# Altium project PiggySat-board.PrjPcb
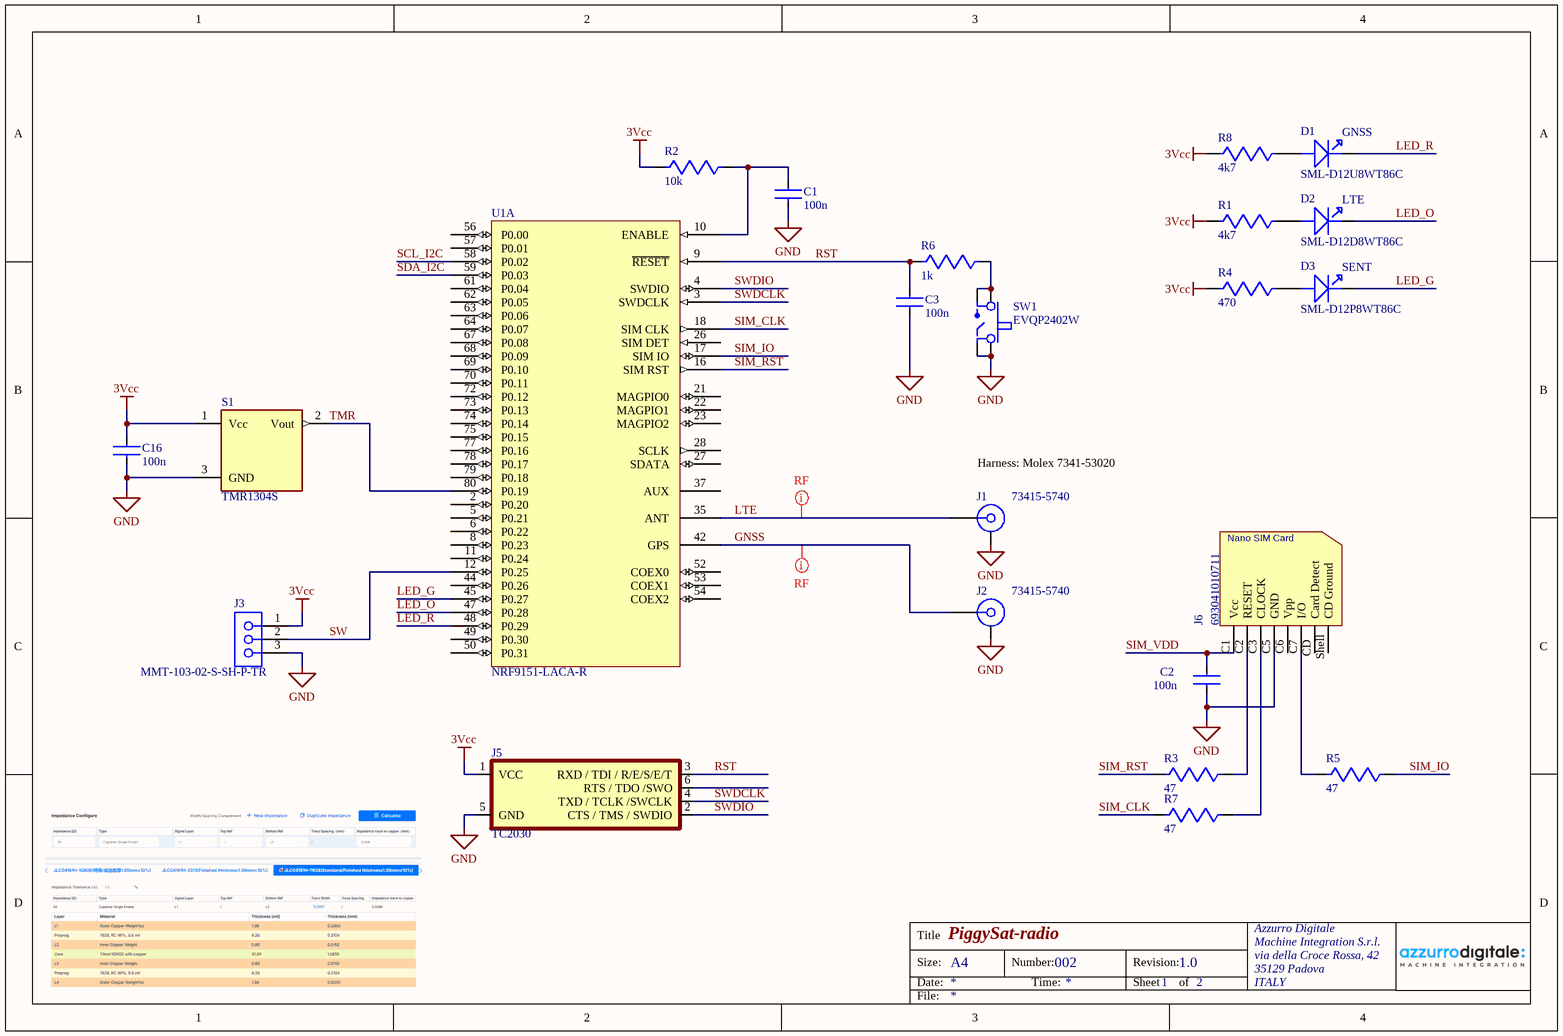
[diagram p0: PiggySat-radio.SchDoc]
2 sheets, 45 parts. Net scope: global (net labels, ports and power ports of the same name join across sheets).
Board file: PiggySat-board.PcbDoc
Sheets:
  PiggySat-radio.SchDoc
  PiggySat-power.SchDoc

## Sheet PiggySat-radio.SchDoc: PiggySat-radio
size A4; DocumentNumber: 002; Revision: 1.0; SheetNumber: 1; SheetTotal: 2

### Parts
C1  100n  [CAPC1608X06L]
C2  100n  [CAPC1608X06L]
C3  100n  [CAPC1608X06L]
C16  100n  [CAPC1608X06L]
D1  SML-D12U8WT86C  [SML-D12]
D2  SML-D12D8WT86C  [SML-D12]
D3  SML-D12P8WT86C  [SML-D12]
J1  73415-5740  [MOLEX_734155740]
J2  73415-5740  [MOLEX_734155740]
J3  MMT-103-02-S-SH-P-TR  [MMT-103-01-SM-SH-TR]
J5  TC2030  [TC2030-IDC]  (no BOM)
J6  693041010711  [693041010711]
R1  4k7  [RESC1005X04L]
R2  10k  [RESC1005X04L]
R3  47  [RESC1005X04L]
R4  470  [RESC1005X04L]
R5  47  [RESC1005X04L]
R6  1k  [RESC1005X04L]
R7  47  [RESC1005X04L]
R8  4k7  [RESC1005X04L]
S1  TMR1304S  [SOT-23-3]
SW1  EVQP2402W  [EVQP2402W]
U1  NRF9151-LACA-R  [FP-nRF9151-LACA-R_MFG]  (part A of 2)

### Nets
3Vcc: C16.1 J3.1 J5.1(VCC) R1.1 R2.1 R4.1 R8.1 S1.1(Vcc)
GND: C1.2 C2.1 C3.1 C16.2 J1.2 J2.2 J3.3 J5.5(GND) J6.C5(GND) S1.3(GND) SW1.1 SW1.3
GNSS: J2.1 U1.42(GPS)
LED_G: D3.2 U1.45(P0.27)
LED_O: D2.2 U1.47(P0.28)
LED_R: D1.2 U1.48(P0.29)
LTE: J1.1 U1.35(ANT)
RST: C3.2 J5.3(RXD_/_TDI_/_R/E/S/E/T) R6.2 U1.9(~{RESET})
SCL_I2C: U1.58(P0.02)
SDA_I2C: U1.59(P0.03)
SIM_CLK: R7.1 U1.18(SIM_CLK)
SIM_IO: R5.2 U1.17(SIM_IO)
SIM_RST: R3.1 U1.16(SIM_RST)
SIM_VDD: C2.2 J6.C1(Vcc)
SW: J3.2 U1.12(P0.25)
SWDCLK: J5.4(TXD_/_TCLK_/SWCLK) U1.3(SWDCLK)
SWDIO: J5.2(CTS_/_TMS_/_SWDIO) U1.4(SWDIO)
TMR: S1.2(Vout) U1.80(P0.19)
NetC1_1: C1.1 R2.2 U1.10(ENABLE)
NetD1_1: D1.1 R8.2
NetD2_1: D2.1 R1.2
NetD3_1: D3.1 R4.2
NetJ6_C2: J6.C2(RESET) R3.2
NetJ6_C3: J6.C3(CLOCK) R7.2
NetJ6_C7: J6.C7(I/O) R5.1
NetR6_1: R6.1 SW1.2 SW1.4

Not connected (* = marked no-connect by the designer): J5 6(RTS_/_TDO_/SWO); J6 C6(Vpp) CD(Card_Detect) Shell(CD_Ground); U1 2(P0.20) 5(P0.21) 6(P0.22) 8(P0.23) 11(P0.24) 21(MAGPIO0) 22(MAGPIO1) 23(MAGPIO2) 26(SIM_DET) 27(SDATA) 28(SCLK) 37(AUX) 44(P0.26) 49(P0.30) 50(P0.31) 52(COEX0) 53(COEX1) 54(COEX2) 56(P0.00) 57(P0.01) 61(P0.04) 62(P0.05) 63(P0.06) 64(P0.07) 67(P0.08) 68(P0.09) 69(P0.10) 70(P0.11) 72(P0.12) 73(P0.13) 74(P0.14) 75(P0.15) 77(P0.16) 78(P0.17) 79(P0.18)

### Layout directives
net class RF: GNSS, LTE

### Notes on the sheet
- (near D1) GNSS
- (near D2) LTE
- (near D3) SENT
- (near J1) Harness: Molex 7341-53020
- Title
- Size:
- Date:
- A4
- Number:
- Time:
- Revision:
- Sheet
- of
- Azzurro Digitale
- Machine Integration S.r.l.
- via della Croce Rossa, 42
- 35129 Padova
- ITALY
- File:
- (in symbol CMP-03913-167535528-1) Nano SIM Card

### Library data of the parts
C1-C3 C16 = CMP-001-00001-3: Cap 16V 100n X7R 0603 10%; Component Class: Capacitors
D1 = CMP-007-000019-1: LED, 0603, Red, SMD, 0,8mm x 1,6mm, 20 mA, 2.2 V, 620 nm; Cod. Alt.: (); Comment1: LED0805; Cod. Mag.: LV-SMD-0805; Design Item ID: SML-D12U8WT86C; Montaggio: (); Cod. Fornitore: (); Prezzo: (); Source: Altium_Library.SchLib; Fornitore: ()
D2 = CMP-007-000019-1: LED, 0603, Orange, SMD, 0,8mm x 1,6mm, 20 mA, 2.2 V, 620 nm; Cod. Alt.: (); Comment1: LED0805; Cod. Mag.: LV-SMD-0805; Design Item ID: SML-D12D8WT86C; Montaggio: (); Cod. Fornitore: (); Prezzo: (); Source: Altium_Library.SchLib; Fornitore: ()
D3 = CMP-007-000018-1: LED, 0603, Green, SMD, 0,8mm x 1,6mm, 20 mA, 2.2 V, 560 nm; Cod. Fornitore: (); Comment1: LED0805; Cod. Mag.: LV-SMD-0805; Fornitore: (); Montaggio: (); Design Item ID: SML-D12P8WT86C; Prezzo: (); Source: Altium_Library.SchLib; Cod. Alt.: ()
J1 J2 = 73415-5740: SMP PLUG, PCB EDGE MNT, SMOOTH B; Manufacturer: MOLEX; System: Connector; ComponentLink5Description: Webshop / RFQ; ComponentLink5URL: http://www.rosenberger.com/en/contact/sales/; ComponentLink3URL: http://rosenberger.de/ok/images/documents/db/32K145-400L5.pdf; ComponentLink2URL: http://rosenberger.de/ok/images/documents/db/32K145-400L5.pdf; ComponentLink4Description: Series Overview / Design Note; ComponentLink1Description: Manufacturer URL; ComponentLink2Description: Datasheet; ComponentLink3Description: Package Specification; ComponentLink1URL: http://www.rosenberger.de; ComponentLink4URL: http://rosenberger.de/ok/images/documents/spez/32.pdf; Mounting Technology: Surface Mount
J3 = MMT-103-01-SM-SH-TR: MMT Series 2.00 mm Horizontal Surface Mount Terminal Strip; System: Connector
J5 = CMP-002-000000-4: Serial cable 6-pin “Legged” Tag-Connector.
J6 = CMP-03913-167535528-1: WR-CRD SIM Card Connectors /
R1 R8 = CMP-009-00001-2: Res 4.7k 0402
R2 = CMP-009-00001-2: Res 10k 0402
R3 R5 R7 = CMP-009-00001-2: Res 47 0402
R4 = CMP-009-00001-2: Res 470 0402
R6 = CMP-009-00001-2: Res 1k 0402
S1 = CMP-00000-2: TMR130x is an omnipolar magnetic switch integrated the tunnel magnetoresistance (TMR) magnetic sensor and CMOS circuitry
SW1 = CMP-017-000001-1: Light Touch Switches/EVQP2/P9/3P2; Design Item ID: EVQP2402W; Source: Altium_Library.SchLib
U1 = CMP-00045-6: Lower Power SIP for cellular IoT and DECT NR+, Compatible with nRF Cloud Services; Number of ADC Channels: 8; Interface: 2-Wire, I2C, I2S, SPI, UART, USB; Max Supply Voltage: 5.5V; Number of GPIO: 32; Data Rate: 3.4Mbps; Bandwidth: 1.5GHz; Min Supply Voltage: 1.7V; Clock Frequency: 2.2GHz; Min Operating Temperature: -40°C; Height: 1.3mm; Max Operating Temperature: 85°C; RoHS: Compliant; Ambient Temperature Range High: 85°C

## Sheet PiggySat-power.SchDoc: PiggySat-power
size A4; DocumentNumber: 003; Revision: 1.0; SheetNumber: 2; SheetTotal: 2
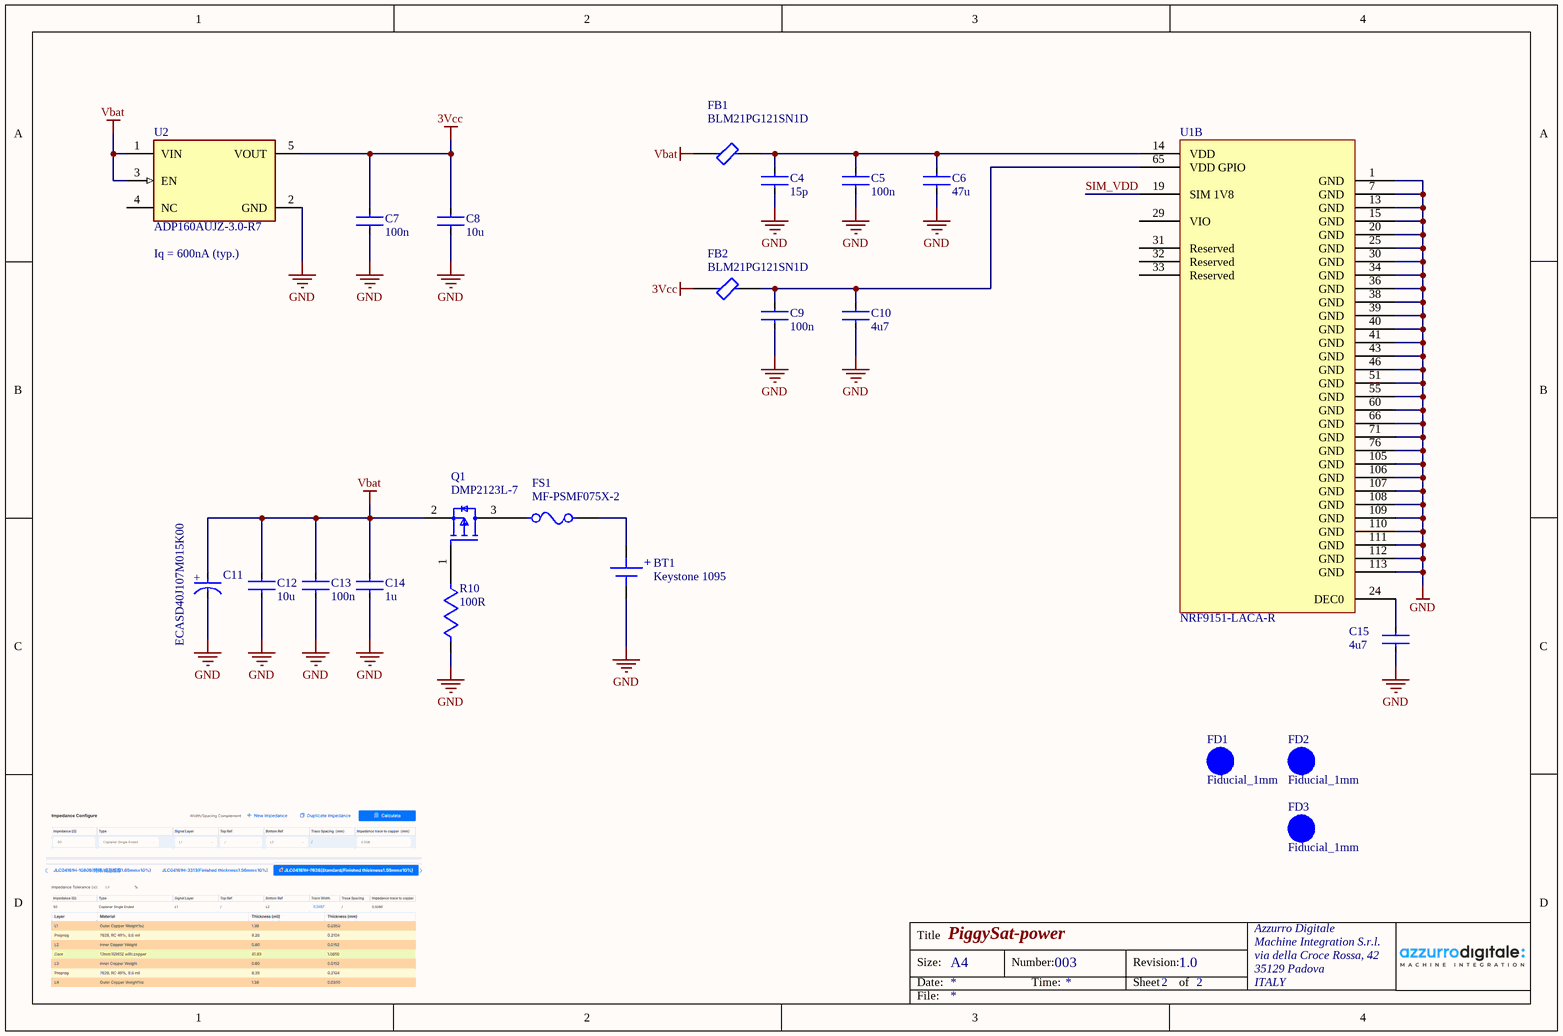
[diagram p1: PiggySat-power.SchDoc]

### Parts
BT1  Keystone 1095  [KEYSTONE 1095]
C4  15p  [CAPC1608X06L]
C5  100n  [CAPC1608X06L]
C6  47u  [CAPC2012X11L]
C7  100n  [CAPC1608X06L]
C8  10u  [CAPC1608X06L]
C9  100n  [CAPC1608X06L]
C10  4u7  [CAPC1608X06L]
C11  ECASD40J107M015K00  [FP-ECAS-D4-MFG]
C12  10u  [CAPC1608X06L]
C13  100n  [CAPC1608X06L]
C14  1u  [CAPC1608X06L]
C15  4u7  [CAPC1608X06L]
FB1  BLM21PG121SN1D  [FP-BLM21-0_2-t0_85-e0_5-d-IPC_C]
FB2  BLM21PG121SN1D  [FP-BLM21-0_2-t0_85-e0_5-d-IPC_C]
FD1  Fiducial_1mm  [Fiducial_1mm-Footprint-1]  (no BOM)
FD2  Fiducial_1mm  [Fiducial_1mm-Footprint-1]  (no BOM)
FD3  Fiducial_1mm  [Fiducial_1mm-Footprint-1]  (no BOM)
FS1  MF-PSMF075X-2  [FP-MF-PSMF-MFG]
Q1  DMP2123L-7  [FP-SOT23-MFG]
R10  100R  [RESC1005X04L]
U1  NRF9151-LACA-R  [FP-nRF9151-LACA-R_MFG]  (part B of 2)
U2  ADP160AUJZ-3.0-R7  [FP-UJ-5-IPC_A]

### Nets
3Vcc: C7.2 C8.2 FB2.2 U2.5(VOUT)
GND: BT1.N C4.1 C5.1 C6.1 C7.1 C8.1 C9.1 C10.1 C11.1(C) C12.1 C13.1 C14.1 C15.1 R10.2 U1.1(GND) U1.7(GND) U1.13(GND) U1.15(GND) U1.20(GND) U1.25(GND) U1.30(GND) U1.34(GND) U1.36(GND) U1.38(GND) U1.39(GND) U1.40(GND) U1.41(GND) U1.43(GND) U1.46(GND) U1.51(GND) U1.55(GND) U1.60(GND) U1.66(GND) U1.71(GND) U1.76(GND) U1.105(GND) U1.106(GND) U1.107(GND) U1.108(GND) U1.109(GND) U1.110(GND) U1.111(GND) U1.112(GND) U1.113(GND) U2.2(GND)
Vbat: C11.2(A) C12.2 C13.2 C14.2 FB1.2 Q1.2(S) U2.1(VIN) U2.3(EN)
SIM_VDD: U1.19(SIM_1V8)
NetBT1_P: BT1.P FS1.2
NetC4_2: C4.2 C5.2 C6.2 FB1.1 U1.14(VDD)
NetC9_2: C9.2 C10.2 FB2.1 U1.65(VDD_GPIO)
NetC15_2: C15.2 U1.24(DEC0)
NetFS1_1: FS1.1 Q1.3(D)
NetQ1_1: Q1.1(G) R10.1

Not connected (* = marked no-connect by the designer): U1 29(VIO) 31(Reserved) 32(Reserved) 33(Reserved); U2 4(NC)

### Notes on the sheet
- (near U2) Iq = 600nA (typ.)
- Title
- Size:
- Date:
- A4
- Number:
- Time:
- Revision:
- Sheet
- of
- Azzurro Digitale
- Machine Integration S.r.l.
- via della Croce Rossa, 42
- 35129 Padova
- ITALY
- File:
- (in symbol CMP-06031-000020-2) +
- (in symbol Keystone 1095) +

### Library data of the parts
BT1 = Keystone 1095: THM Holder for 18350 Battery P/N 1095
C4 = CMP-001-00001-3: Cap 16V 15p X7R 0603 10%; Component Class: Capacitors
C5 C7 C9 C13 = CMP-001-00001-3: Cap 16V 100n X7R 0603 10%; Component Class: Capacitors
C6 = CMP-001-00002-1: Cap 16V 47u X7R 0603 10%
C8 C12 = CMP-001-00001-3: Cap 16V 10u X7R 0603 10%; Component Class: Capacitors
C10 C15 = CMP-001-00001-3: Cap 16V 4.7u X7R 0603 10%; Component Class: Capacitors
C11 = CMP-06031-000020-2: Polymer Aluminum Electrolytic Capacitor 2917 100uF±20% 6.3V 15mΩ; Resistance: 0.015R; Polarity: Polar; Tolerance: 20%; Ripple Current: 2A; Life (Hours): 1000Hour; ESR (Equivalent Series Resistance): 15mR; Capacitance: 100uF; Depth: 4.3mm; Package Quantity: 1; Max Operating Temperature: 105°C; Voltage Rating: 6.3V; Termination: SMD/SMT; Radiation Hardening: No; Mount: Surface Mount; Construction: Flat; Case/Package: 2917; Case Code (Imperial): 2917; Height - Seated (Max): 0.075inch; Length: 7.3mm; Packaging: Tape and Reel; Width: 0.169inch; Series: ECAS; Weight: 0.023634oz; Lead Free: Lead Free; Min Operating Temperature: -40°C; Voltage Rating (DC): 6.3V; Height: 1.9mm; Case Code (Metric): 7343; RoHS Compliant: Yes
C14 = CMP-001-00001-3: Cap 16V 1u X7R 0603 10%; Component Class: Capacitors
FB1 FB2 = CMP-0686-00612-3: Chip Ferrite Bead, 0805, 120Ω @ 100MHz, 0.03Ω, 25%, 3A; Impedance: 120R; Number of Circuits: 1; Material: Steel; DC Resistance (DCR): 30mR; Package Quantity: 1; Lead Free: Lead Free; Width: 1.25mm; Number of Pins: 2; Depth: 1.25mm; Case Code (Imperial): 0805; Tolerance: 25%; Current Rating: 3A; Test Frequency: 100MHz; Length: 2mm; Min Operating Temperature: -55°C; Max Current Rating: 3A; REACH SVHC: No SVHC; Series: BLM21P; Height: 0.85mm; Max DC Current: 3A; Termination: SMD/SMT; Max Operating Temperature: 125°C; Number of Lines: 1; Case/Package: 0805; RoHS Compliant: Yes; Packaging: Tape and Reel; Case Code (Metric): 2012; DC Resistance-Max: 30mR
FD1-FD3 = CMP-00017-7: 1mm fiducial marker
FS1 = CMP-07400-000017-1: PTC RESET FUSE 6V 750MA 0805; Manufacturer Part Number: MF-PSMF010X-2; Manufacturer: Bourns Inc.; Resistance: 1-7.5Ω; Value: 1-7.5Ω; Current Rating: 40A; Hold Current: 0.1A; Trip Current: 0.3A; Voltage Rating: 15V; Trip Time: 1.5s; Temperature: -40°C to +85°C; ComponentLink2Description: Datasheet; Lead Free: Yes; Ipc Land Pattern Name: CAPC215135X67; Device Class L1: Circuit Protection; Mouser Description: Resettable Fuses - PPTC 0.10A 15V 1ohm; Automotive: No; Octopart: https://octopart.com/mf-psmf010x-2-bourns-7483441; RoHS: TRUE; Temperature Range High: +85°C; Digikey Description: PTC RESET FUSE 15V 100MA 0805; Device Class L3: unset; ComponentLink2URL: https://www.bourns.com/docs/Product-Datasheets/mfpsmf.pdf; Height: 0.85mm; Ambient Temperature Range Low: -40°C; Category: Fuse; Package: MF-PSMF; Temperature Range Low: -40°C; Device Class L2: PTC Resettable Fuses; Ambient Temperature Range High: +85°C
Q1 = CMP-00461-12441635-1: DMP2123L-7 P-Channel 20 V 72 mO Surface Mount Enhancement Mode Mosfet - SOT-23; Number of Channels: 1; Power Dissipation: 1.4W; Gate to Source Voltage (Vgs): 12V; Rds On Max: 72mΩ; Drain to Source Breakdown Voltage: -20V; Turn-On Delay Time: 12ns; Turn-Off Delay Time: 38ns; Max Junction Temperature (Tj): 150°C; Element Configuration: Single; Drain to Source Resistance: 51mΩ; Continuous Drain Current (ID): -3A; Fall Time: 41ns; Rise Time: 20ns; Input Capacitance: 443pF; Weight: 7.994566mg; Number of Pins: 3; Schedule B: 8541290080, 8541290080; Max Power Dissipation: 1.4W; REACH SVHC: No SVHC; Mount: Surface Mount; Radiation Hardening: No; Max Operating Temperature: 150°C; Height: 1.1mm; NexarPartId: 12441635; Resistance: 72mΩ; Min Operating Temperature: -55°C; Lead Free: Lead Free; Width: 1.3mm; Drain to Source Voltage (Vdss): -20V; Case/Package: SOT-23-3; Length: 2.9mm; Number of Elements: 1; RoHS: Compliant
R10 = CMP-009-00001-2: Res 100R 0402
U1 = CMP-00045-6: as U1 on sheet PiggySat-radio; Min Operating Temperature: -40°C; Height: 1.3mm; Max Operating Temperature: 85°C; RoHS: Compliant; Ambient Temperature Range High: 85°C
U2 = CMP-09138-000096-1: IC REG LINEAR 3V 150MA TSOT5; Accuracy: 2%; Max Output Voltage: 4.2V; Number of Outputs: 1; Max Supply Current: 42uA; Min Current Limit: 220mA; Min Input Voltage: 2.2V; Dropout Voltage: 120mV; Power Supply Rejection Ratio (PSRR): 60dB; Output Type: Fixed; Min Output Voltage: 1.2V; Polarity: Positive; Quiescent Current: 0mA; Max Input Voltage: 5.5V; Min Operating Temperature: -40°C; Mount: Surface Mount; Length: 2.9mm; Series: -; Contact Plating: Tin; Packaging: Tape and Reel; Number of Pins: 5; Case/Package: TSOT; RoHS Compliant: Yes; Number of Regulators: 1; Nominal Supply Current: 42uA; Width: 1.6mm; Lead Free: Contains Lead; Max Output Current: 150mA; Output Voltage Accuracy: 2%; Height: 0.9mm; Output Voltage: 3V; Output Current: 150mA; Max Operating Temperature: 125°C; Operating Supply Current: 42uA

## Nets that join several sheets
3Vcc: PiggySat-radio (8 pins), PiggySat-power (C7.2 C8.2 FB2.2 U2.5)
GND: PiggySat-radio (12 pins), PiggySat-power (45 pins)
SIM_VDD: PiggySat-radio (C2.2 J6.C1), PiggySat-power (U1.19)